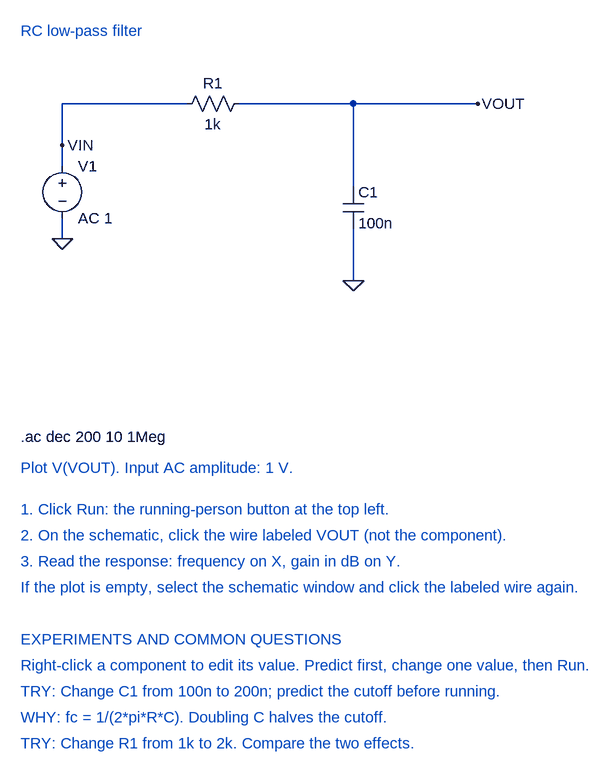
[diagram p0: schematic 01-rc-low-pass.asc]
01-rc-low-pass.asc, the LTspice schematic file:
Version 4
SHEET 1 1200 1400
WIRE 128 208 128 240
WIRE 128 320 128 352
WIRE 128 208 128 144
WIRE 128 144 320 144
WIRE 400 144 768 144
WIRE 576 144 576 272
WIRE 576 336 576 416
FLAG 128 208 VIN
FLAG 128 352 0
FLAG 576 416 0
FLAG 768 144 VOUT
SYMBOL voltage 128 224 R0
SYMATTR InstName V1
SYMATTR Value AC 1
SYMBOL res 416 128 R90
WINDOW 0 0 56 VBottom 2
WINDOW 3 32 56 VTop 2
SYMATTR InstName R1
SYMATTR Value 1k
SYMBOL cap 560 272 R0
SYMATTR InstName C1
SYMATTR Value 100n
TEXT 64 32 Left 2 ;RC low-pass filter
TEXT 64 656 Left 2 !.ac dec 200 10 1Meg
TEXT 64 704 Left 2 ;Plot V(VOUT). Input AC amplitude: 1 V.
TEXT 64 768 Left 2 ;1. Click Run: the running-person button at the top left.
TEXT 64 808 Left 2 ;2. On the schematic, click the wire labeled VOUT (not the component).
TEXT 64 848 Left 2 ;3. Read the response: frequency on X, gain in dB on Y.
TEXT 64 888 Left 2 ;If the plot is empty, select the schematic window and click the labeled wire again.
TEXT 64 968 Left 2 ;EXPERIMENTS AND COMMON QUESTIONS
TEXT 64 1008 Left 2 ;Right-click a component to edit its value. Predict first, change one value, then Run.
TEXT 64 1048 Left 2 ;TRY: Change C1 from 100n to 200n; predict the cutoff before running.
TEXT 64 1088 Left 2 ;WHY: fc = 1/(2*pi*R*C). Doubling C halves the cutoff.
TEXT 64 1128 Left 2 ;TRY: Change R1 from 1k to 2k. Compare the two effects.

The netlist it stands for:
* 01-rc-low-pass.asc
V1 VIN 0 AC 1
R1 VOUT VIN 1k
C1 VOUT 0 100n
* RC low-pass filter
.ac dec 200 10 1Meg
* Plot V(VOUT). Input AC amplitude: 1 V.
* 1. Click Run: the running-person button at the top left.
* 2. On the schematic, click the wire labeled VOUT (not the component).
* 3. Read the response: frequency on X, gain in dB on Y.
* If the plot is empty, select the schematic window and click the labeled wire again.
* EXPERIMENTS AND COMMON QUESTIONS
* Right-click a component to edit its value. Predict first, change one value, then Run.
* TRY: Change C1 from 100n to 200n; predict the cutoff before running.
* WHY: fc = 1/(2*pi*R*C). Doubling C halves the cutoff.
* TRY: Change R1 from 1k to 2k. Compare the two effects.
.backanno
.end